# EasyEDA Pro project ProPrj_μAtlas-Pro_2026-10-24.epro, schematic μAtlas

## Sheets
1 PWR_Management
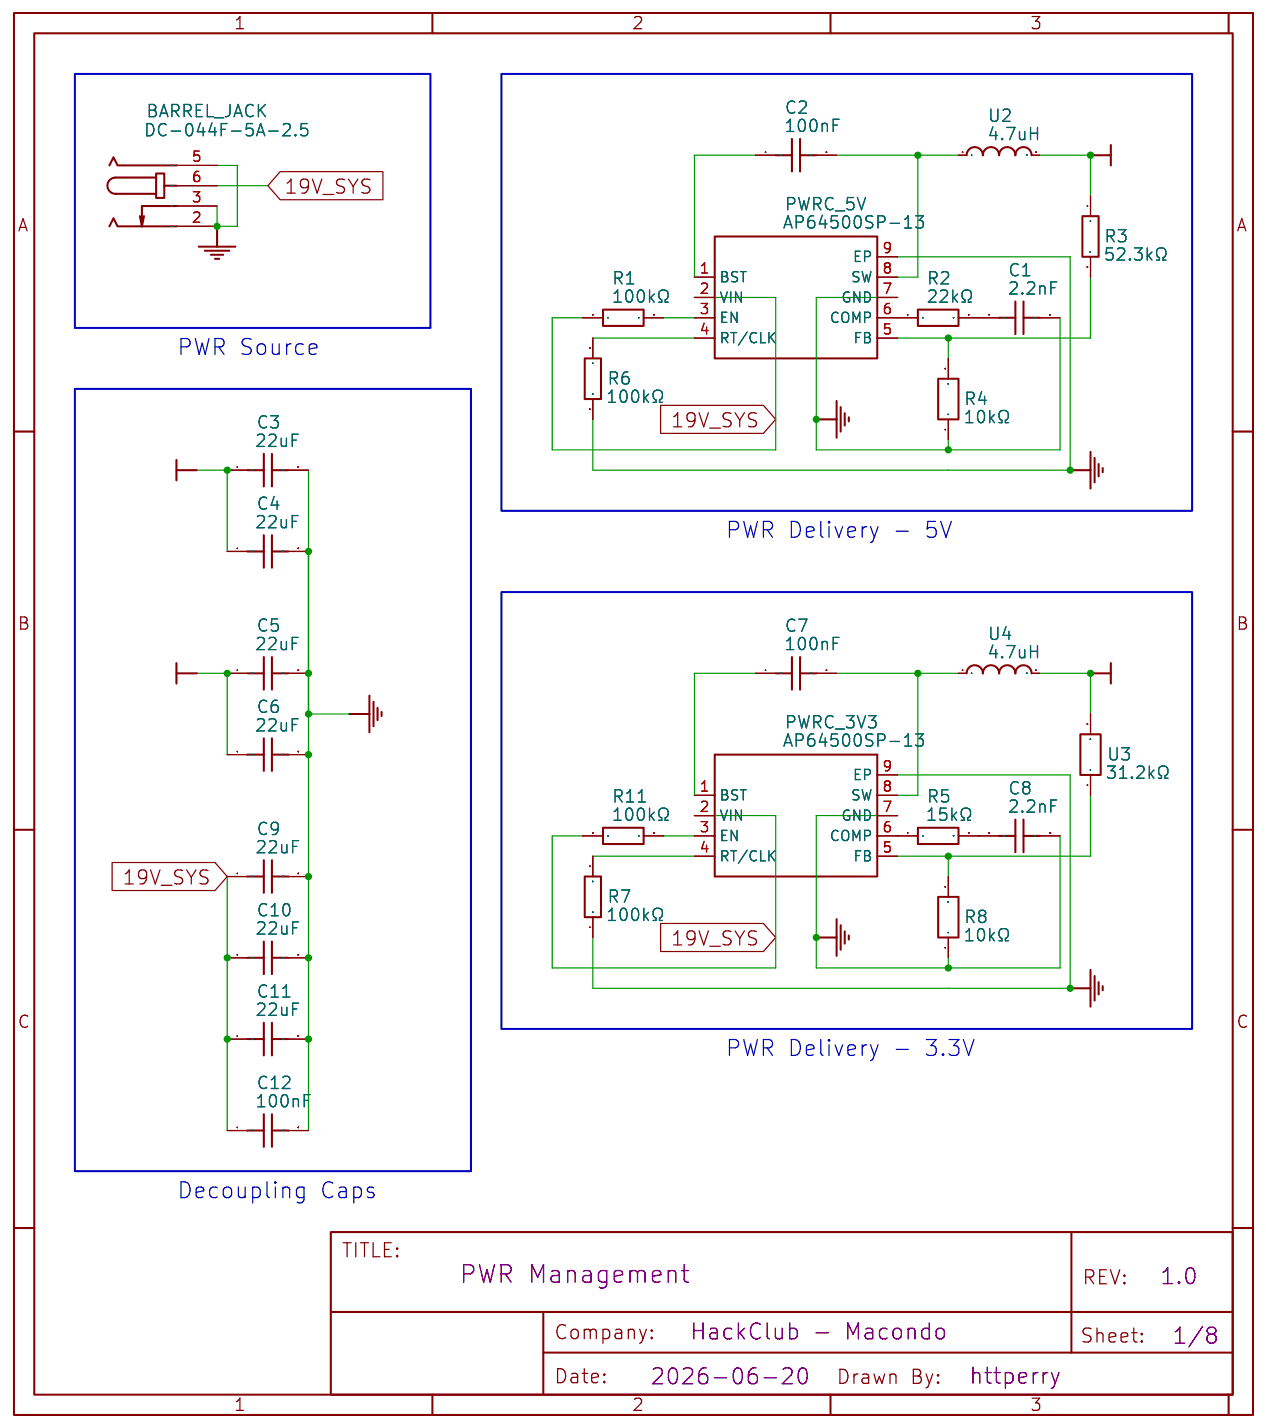
[diagram p0: PWR_Management]
2 SATA_Ports
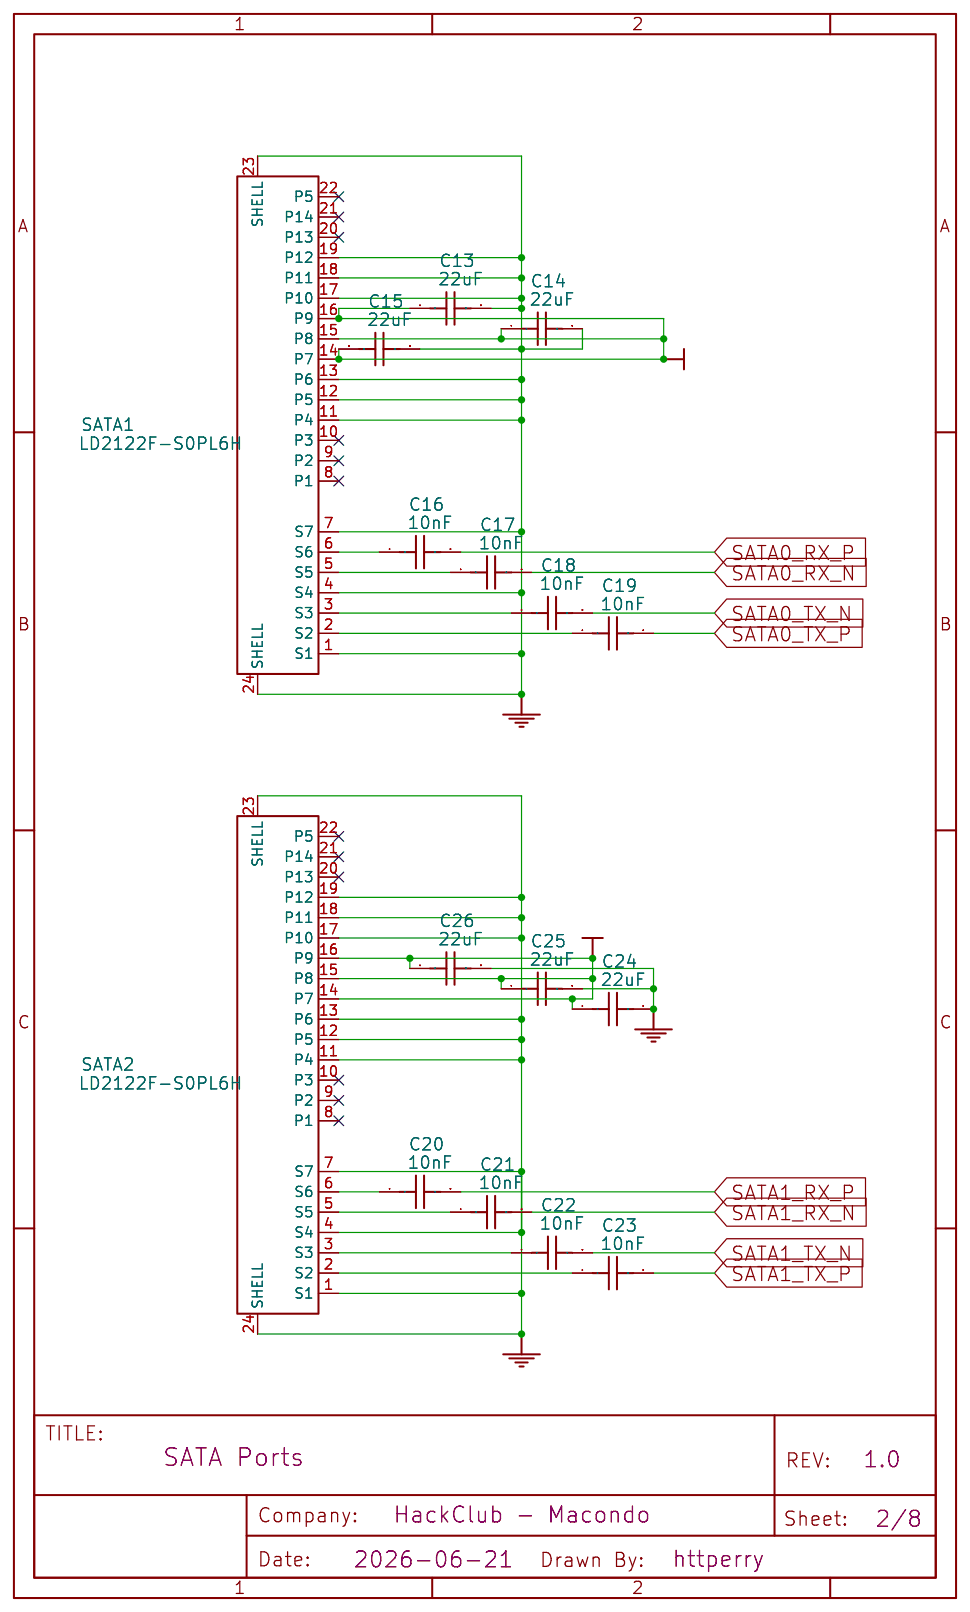
[diagram p1: SATA_Ports]
3 NVMe_(Networking)_Ports
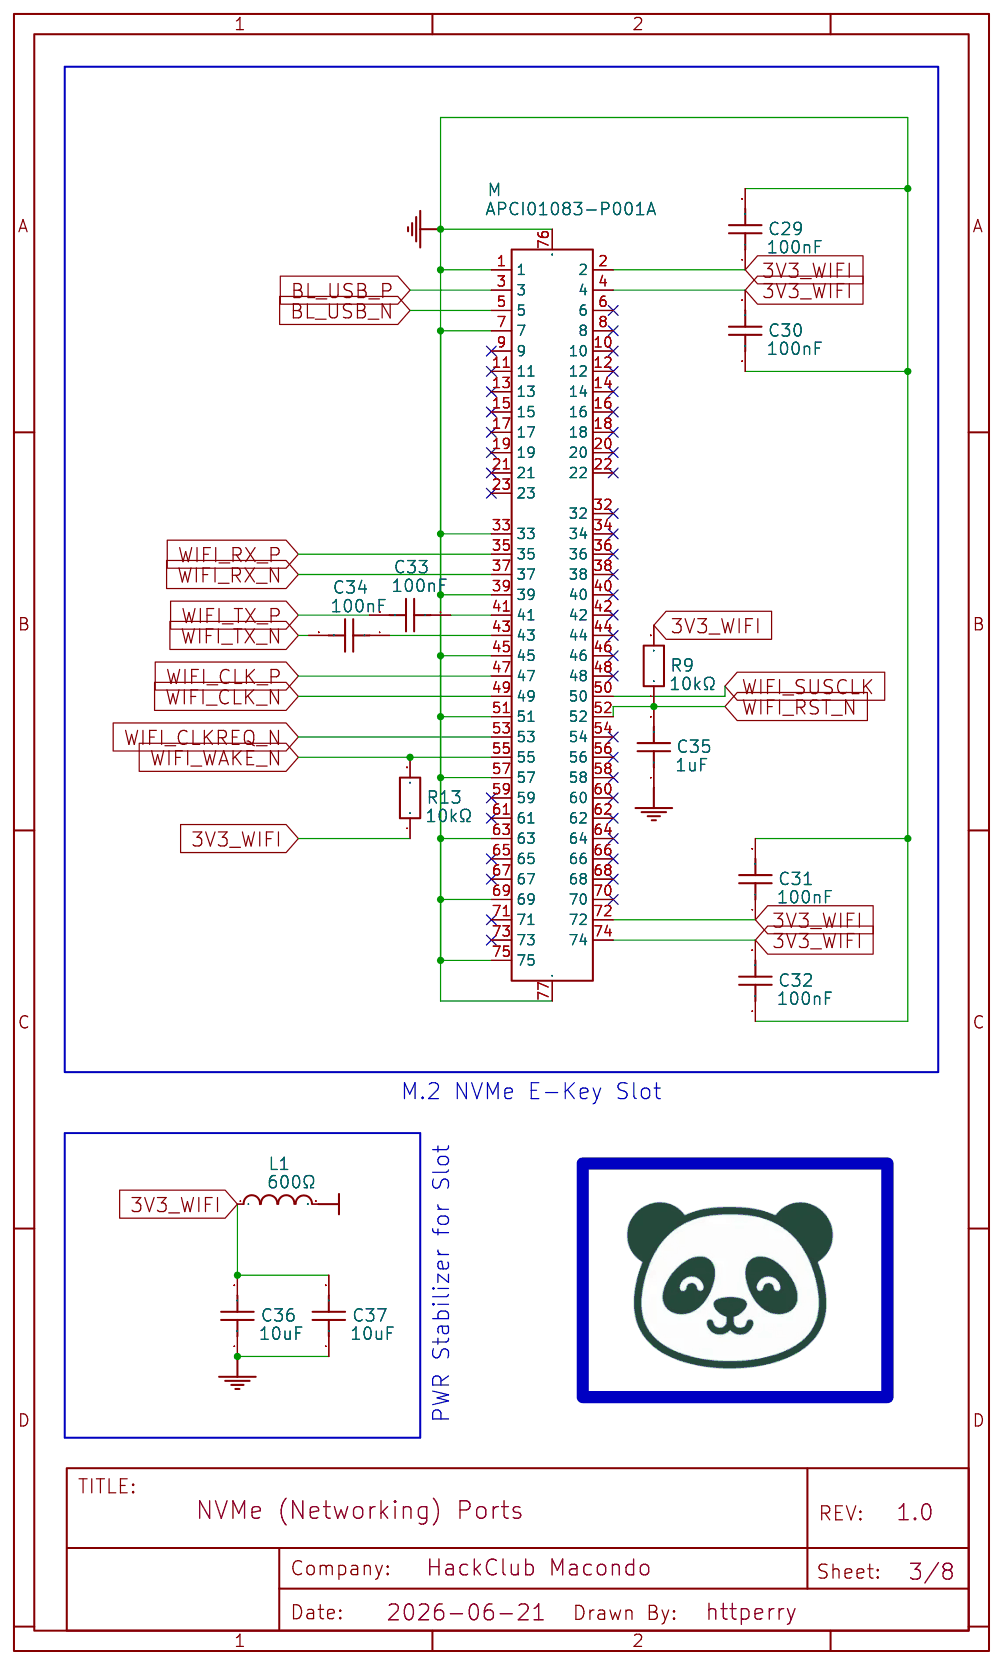
[diagram p2: NVMe_(Networking)_Ports]
4 NVMe_(Storage)_Ports
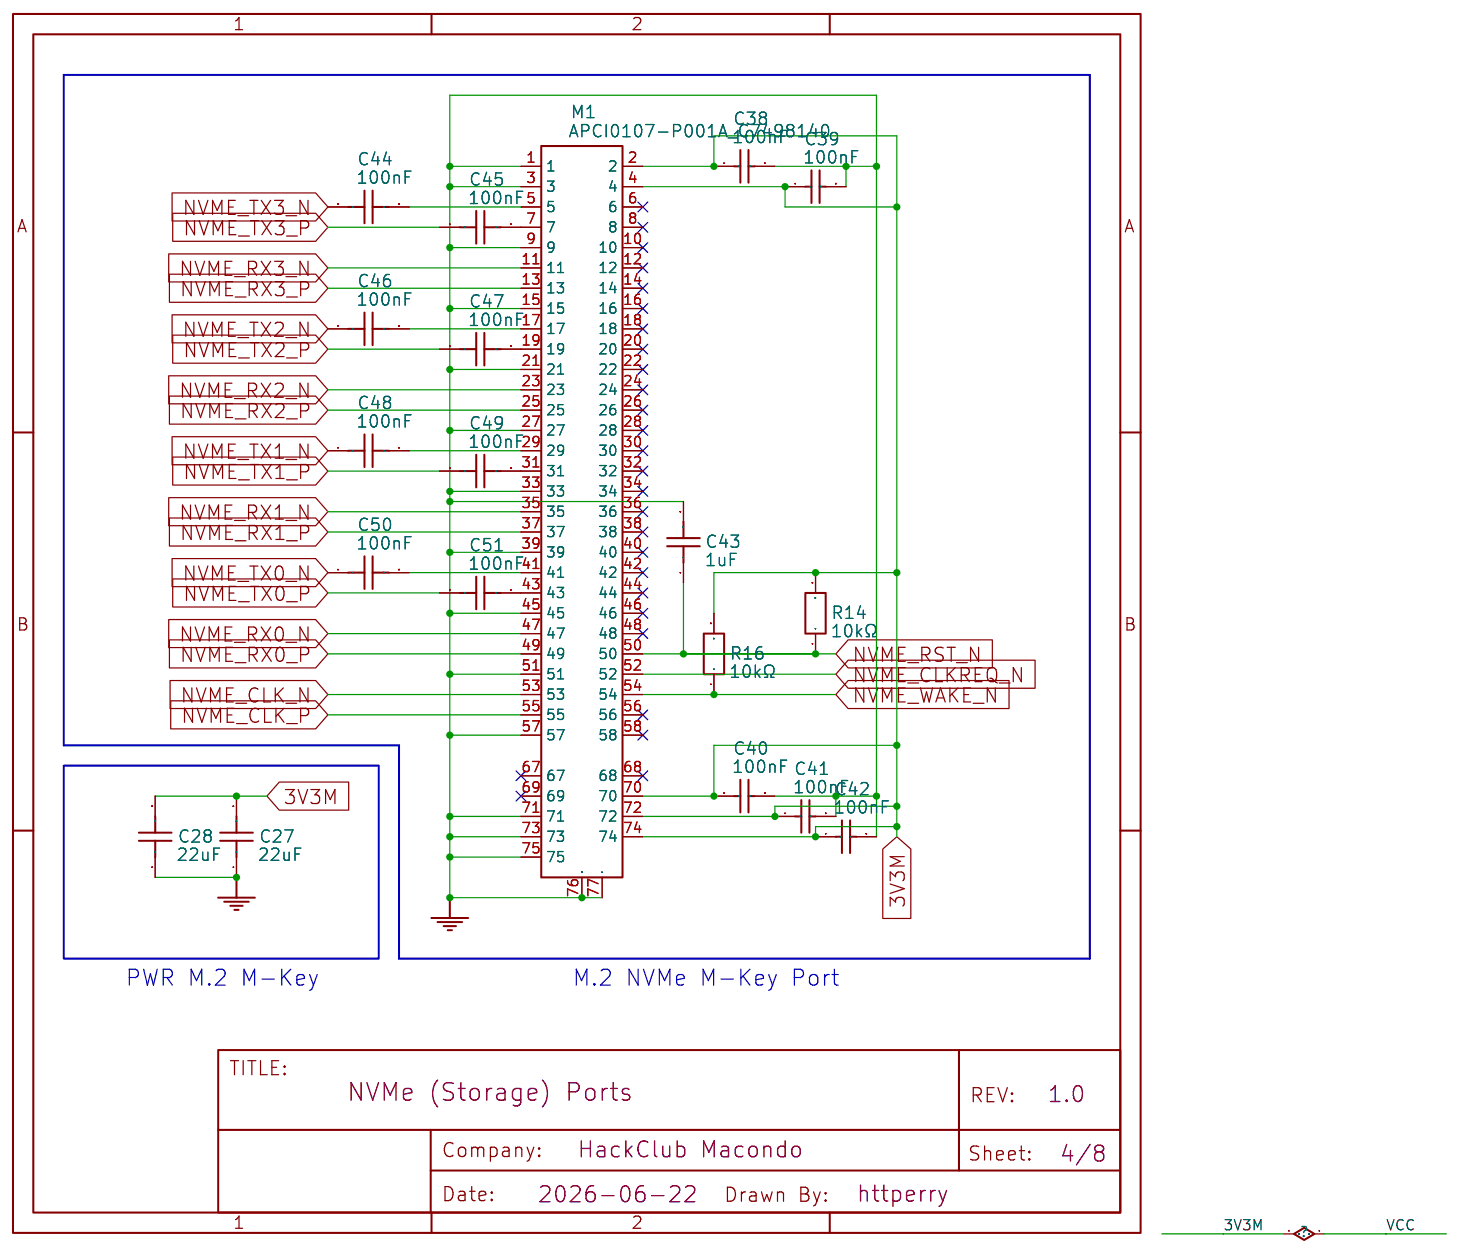
[diagram p3: NVMe_(Storage)_Ports]
5 IO_Ethernet
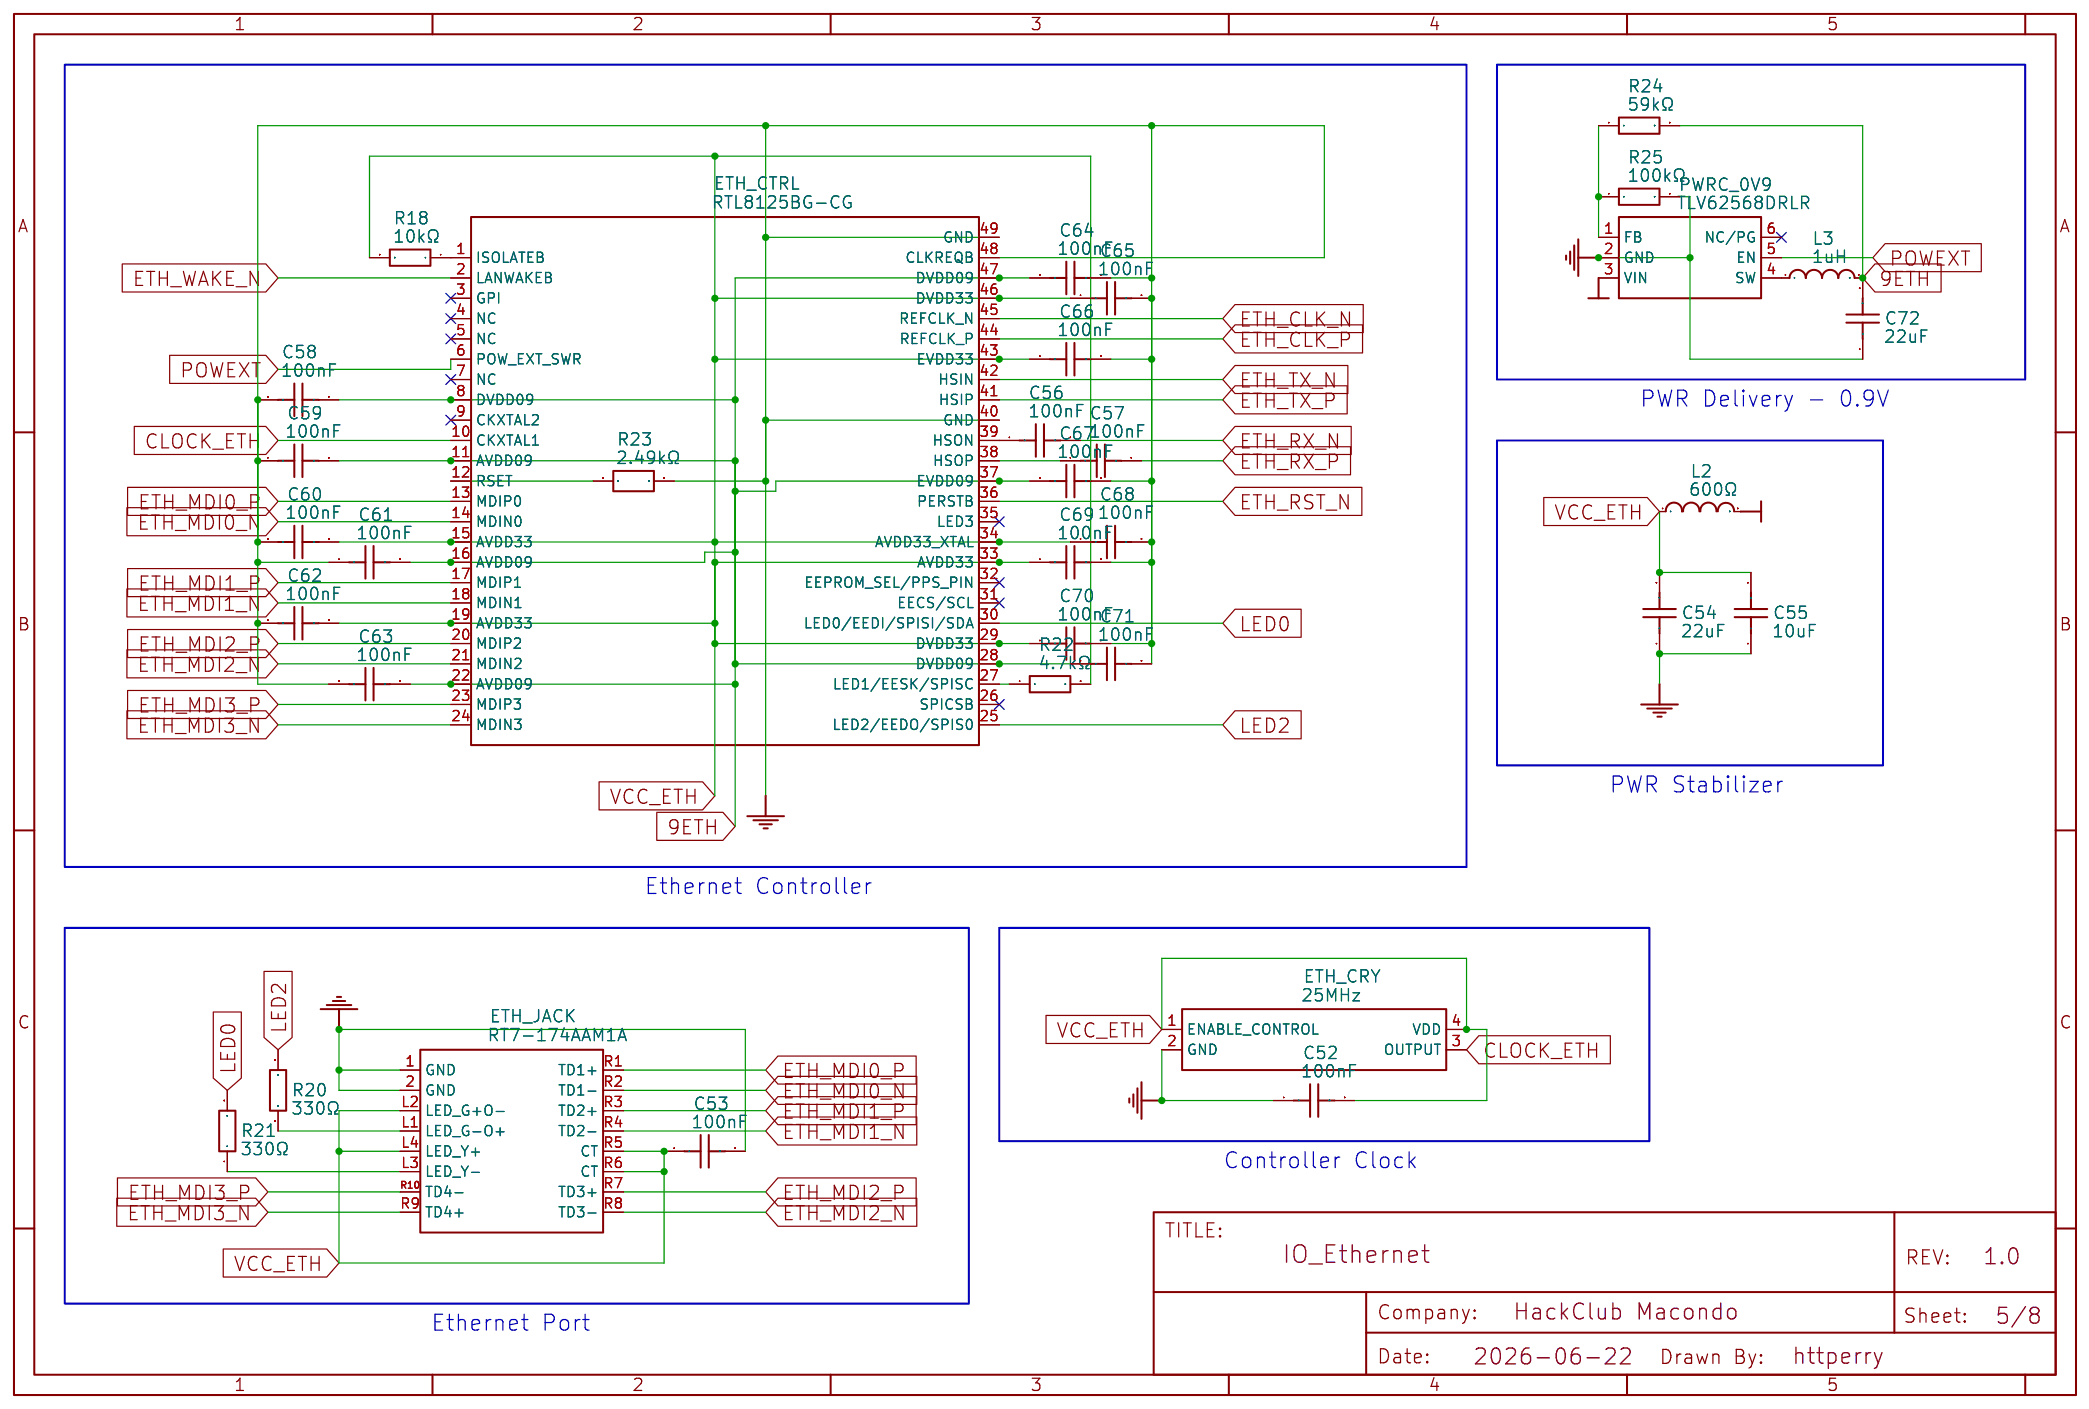
[diagram p4: IO_Ethernet]
6 IO_USB
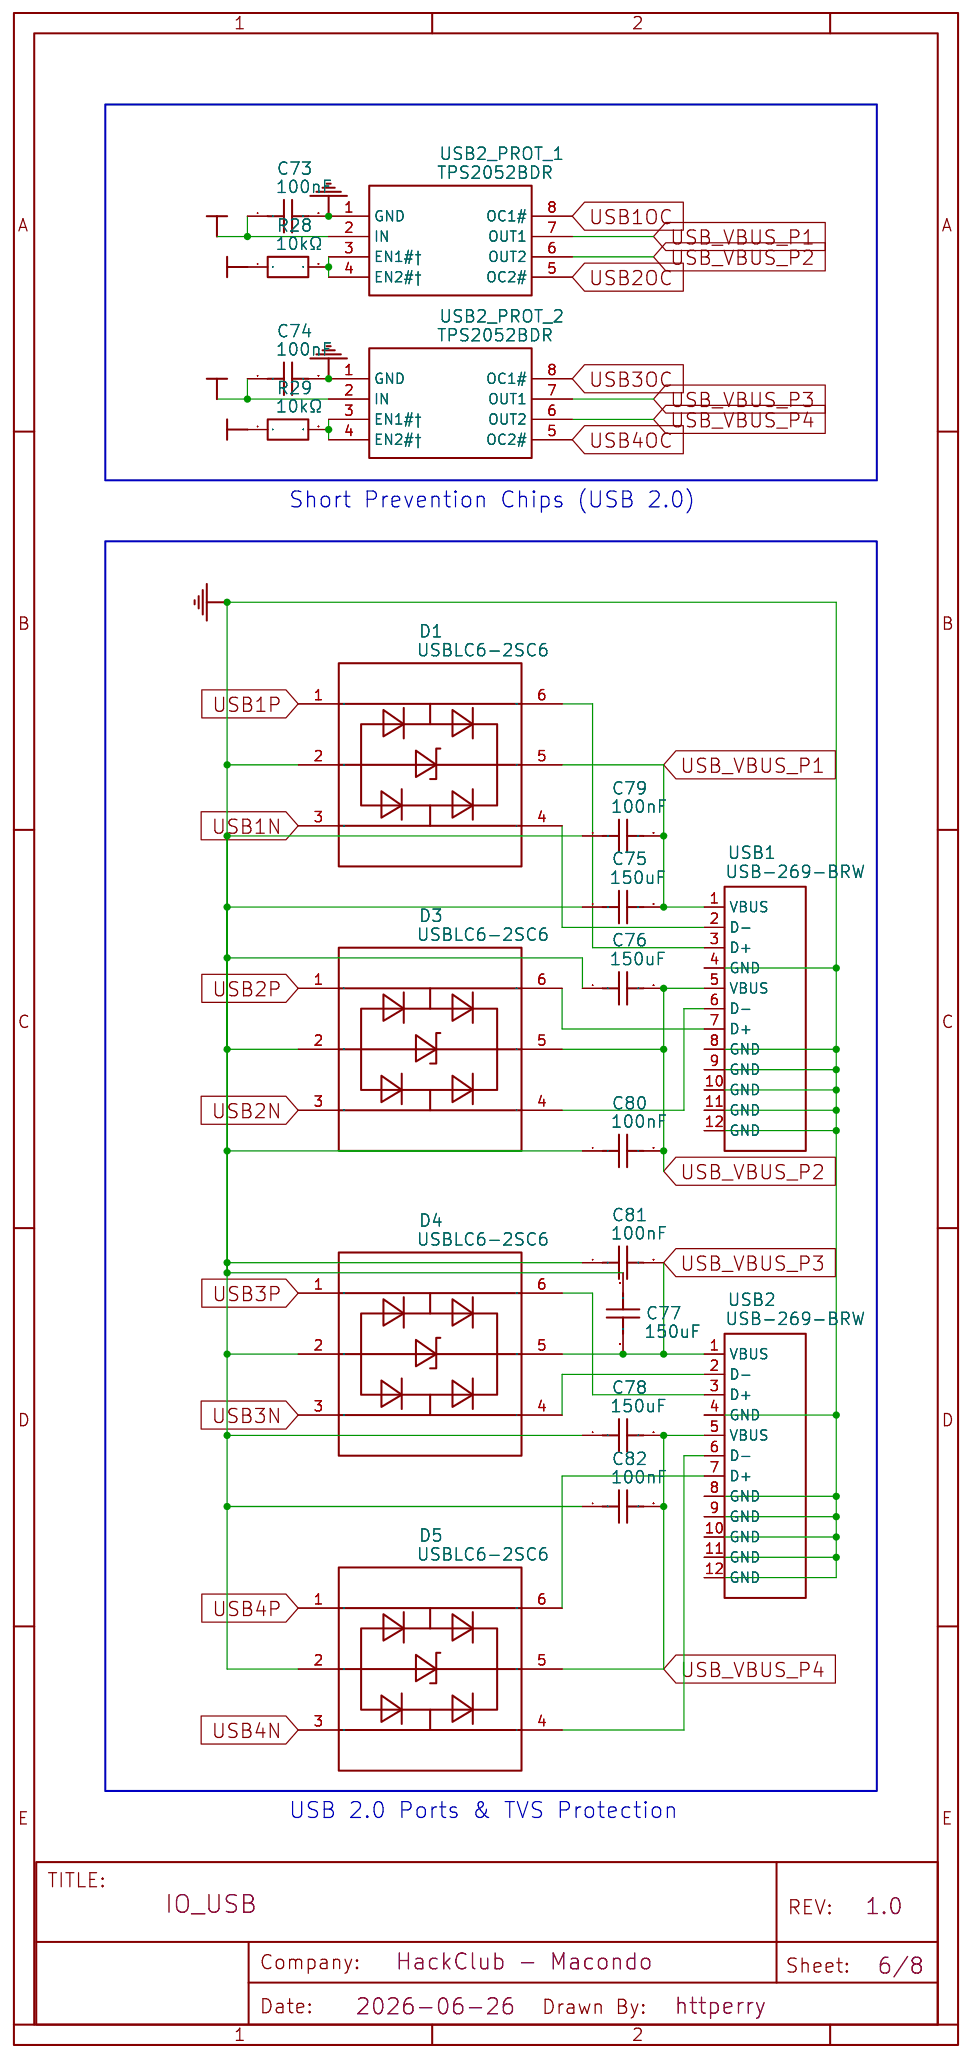
[diagram p5: IO_USB]
7 IO_HDMI
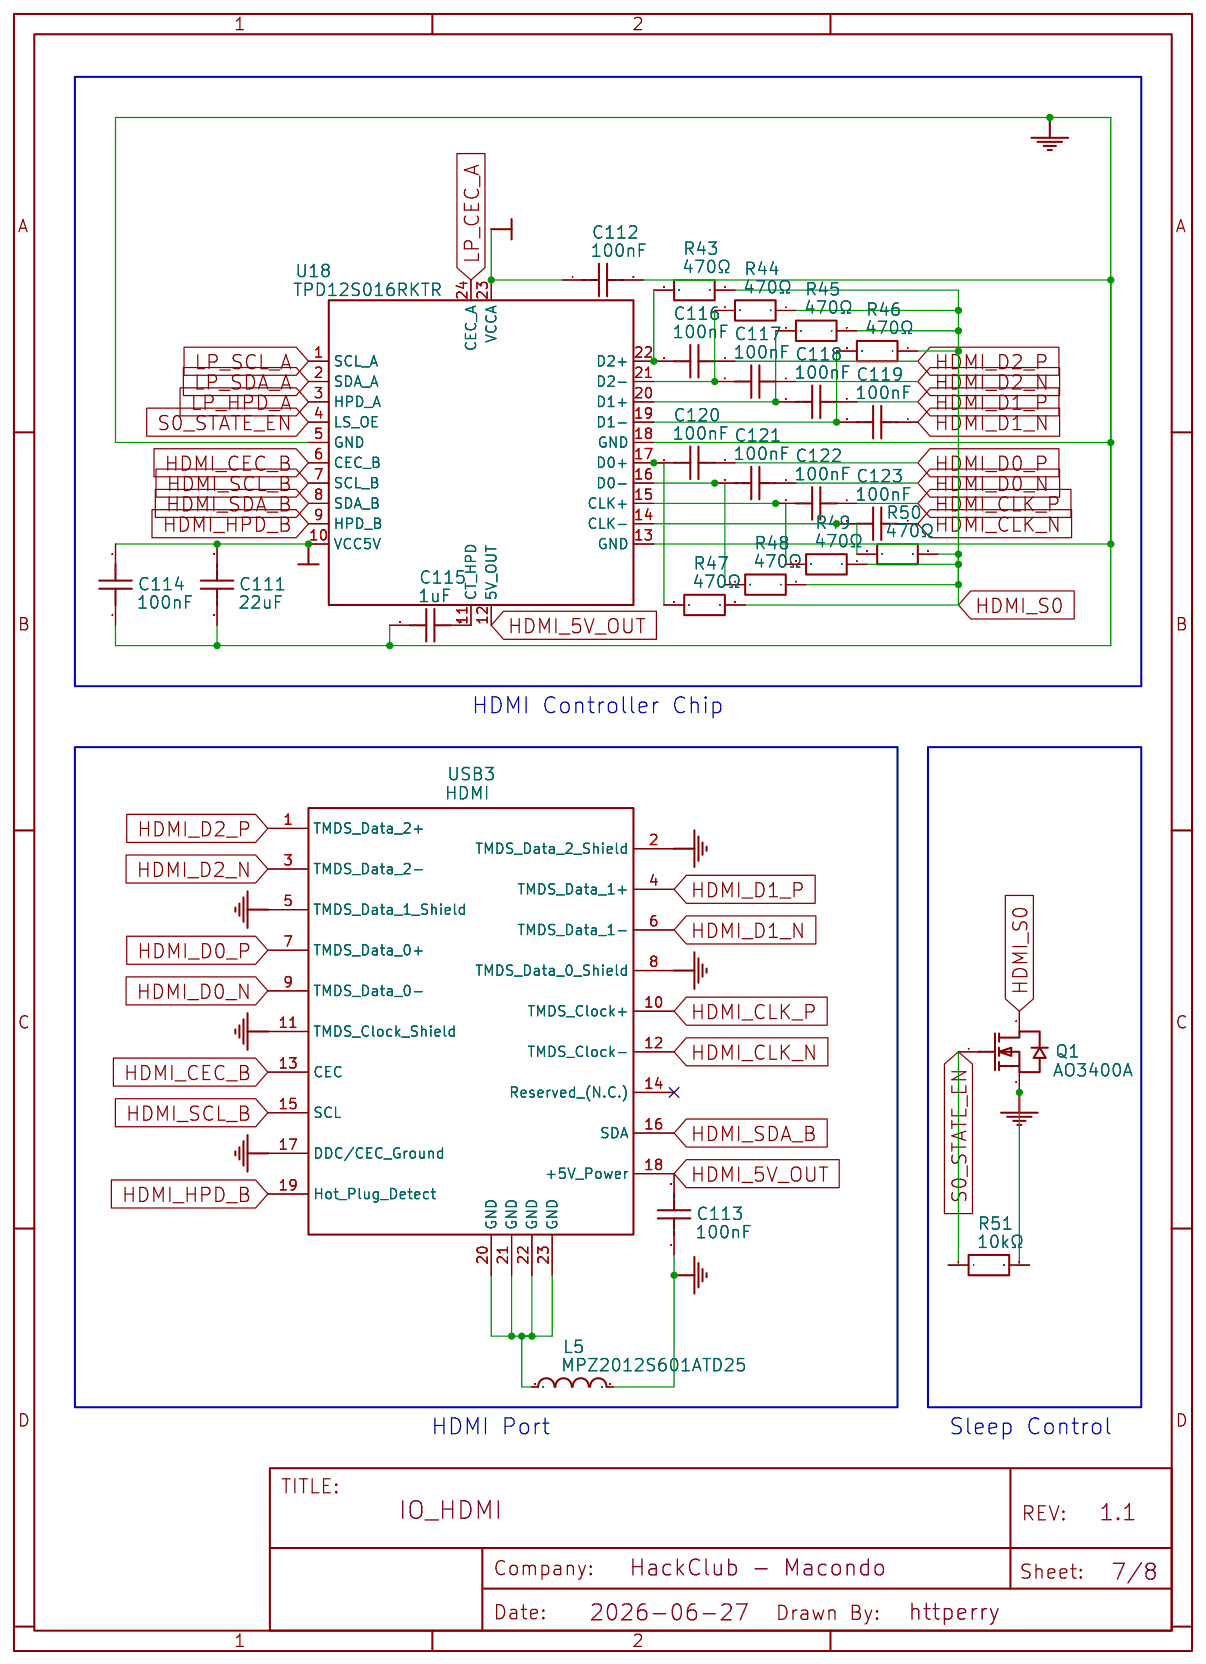
[diagram p6: IO_HDMI]
8 SoM_SODIMM
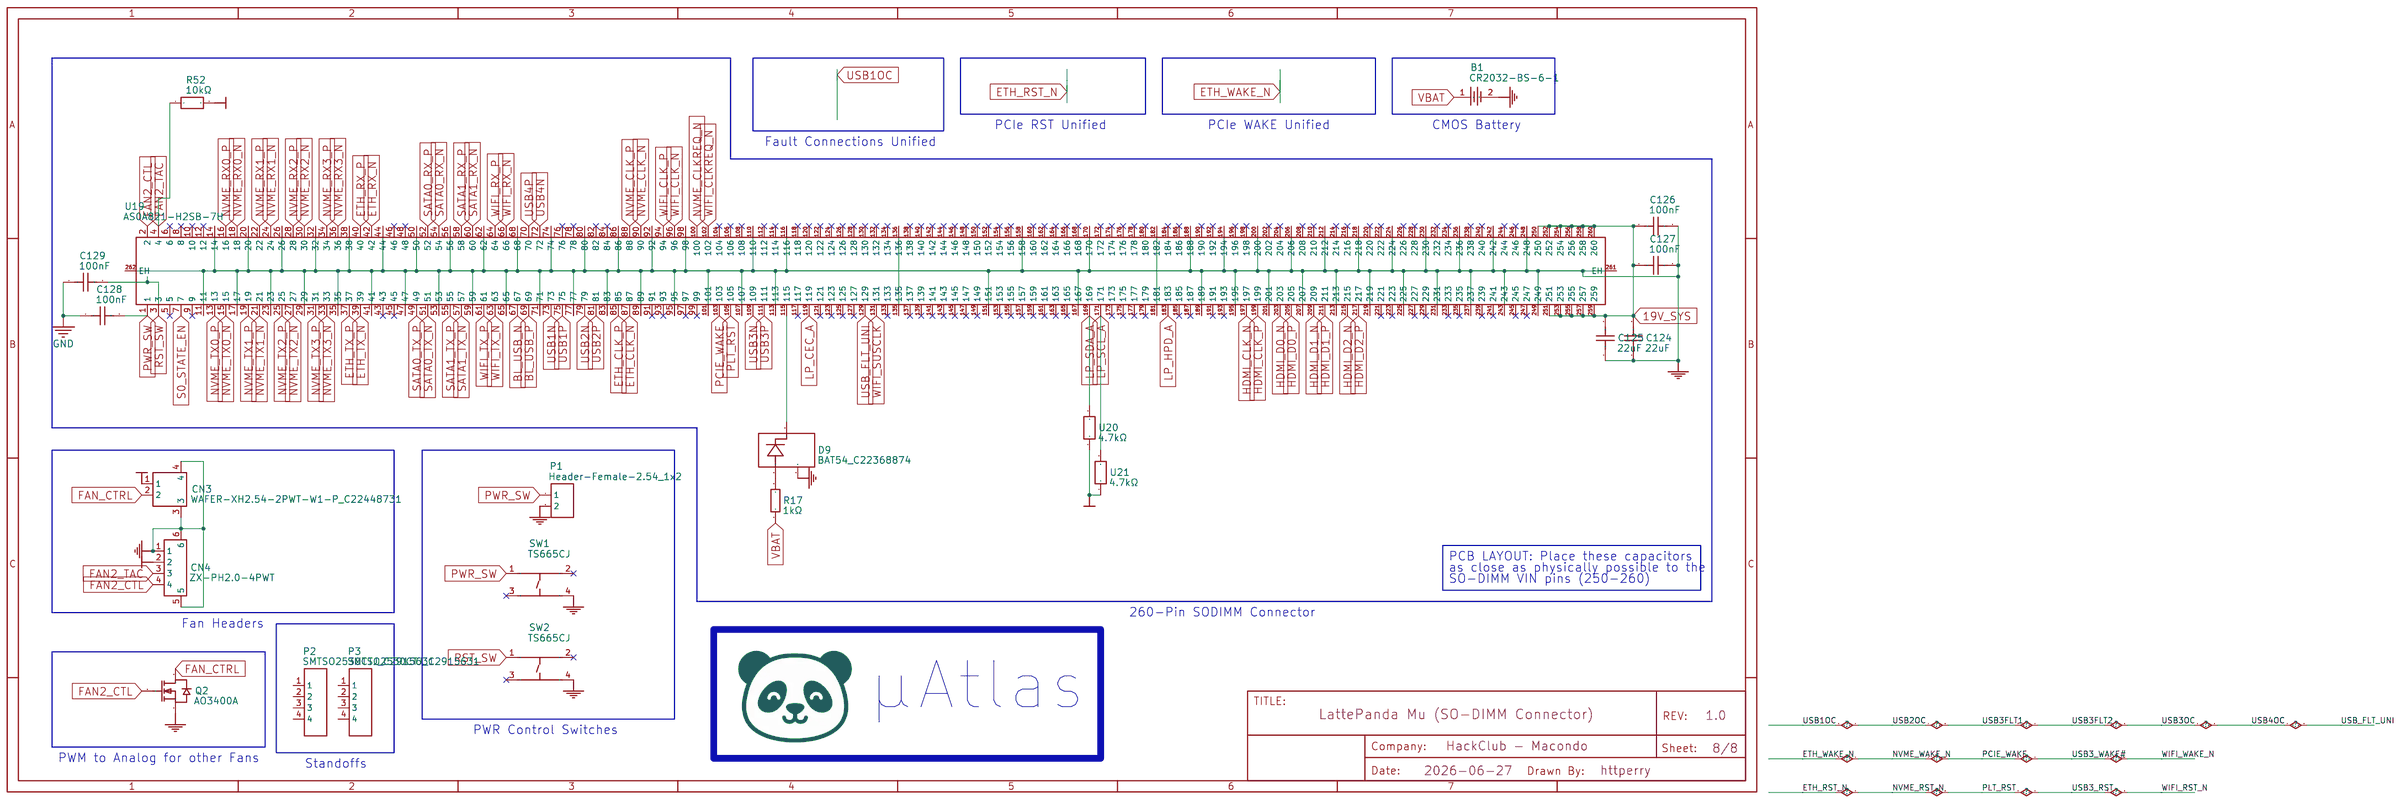
[diagram p7: SoM_SODIMM]

## Parts
sheet IO_Ethernet
C52  100nF  [C0402]
C53  100nF  [C0402]
C54  22uF  [C0805]
C55  10uF  [normalized-easyedapro:C0805]
C56  100nF  [C0402]
C57  100nF  [C0402]
C58  100nF  [C0402]
C59  100nF  [C0402]
C60  100nF  [C0402]
C61  100nF  [C0402]
C62  100nF  [C0402]
C63  100nF  [C0402]
C64  100nF  [C0402]
C65  100nF  [C0402]
C66  100nF  [C0402]
C67  100nF  [C0402]
C68  100nF  [C0402]
C69  100nF  [C0402]
C70  100nF  [C0402]
C71  100nF  [C0402]
C72  22uF  [normalized-easyedapro:C0805]
ETH_CRY  25MHz  [normalized-easyedapro:OSC-SMD_4P-L3.2-W2.5-BL_SG-8018CE]
ETH_CTRL  RTL8125BG-CG  [normalized-easyedapro:TQFN-48_L6.0-W6.0-P0.40-BL-EP4.5]
ETH_JACK  RT7-174AAM1A  [normalized-easyedapro:RJ45-TH_RT7-174AAM1A]
L2  600Ω  [normalized-easyedapro:L0805]
L3  1uH  [normalized-easyedapro:IND-SMD_L2.0-W1.6-B]
PWRC_0V9  TLV62568DRLR  [SOT-563_L1.6-W1.2-P0.50-LS1.6-BL]
R18  10kΩ  [normalized-easyedapro:R0402]
R20  330Ω  [normalized-easyedapro:R0402]
R21  330Ω  [R0402]
R22  4.7kΩ  [normalized-easyedapro:R0402]
R23  2.49kΩ  [normalized-easyedapro:R0402]
R24  59kΩ  [normalized-easyedapro:R0603]
R25  100kΩ  [normalized-easyedapro:R0603]
sheet IO_HDMI
C111  22uF  [C0805]
C112  100nF  [C0402]
C113  100nF  [C0402]
C114  100nF  [C0402]
C115  1uF  [normalized-easyedapro:C0402]
C116  100nF  [normalized-easyedapro:C0402]
C117  100nF  [C0402]
C118  100nF  [normalized-easyedapro:C0402]
C119  100nF  [C0402]
C120  100nF  [C0402]
C121  100nF  [C0402]
C122  100nF  [C0402]
C123  100nF  [C0402]
L5  MPZ2012S601ATD25  [normalized-easyedapro:L0805]
Q1  AO3400A  [normalized-easyedapro:SOT-23-3_L2.9-W1.3-P1.90-LS2.4-BR]
R43  470Ω  [normalized-easyedapro:R0402]
R44  470Ω  [normalized-easyedapro:R0402]
R45  470Ω  [normalized-easyedapro:R0402]
R46  470Ω  [normalized-easyedapro:R0402]
R47  470Ω  [R0402]
R48  470Ω  [R0402]
R49  470Ω  [R0402]
R50  470Ω  [R0402]
R51  10kΩ  [R0402]
U18  TPD12S016RKTR  [normalized-easyedapro:UQFN-24_L4.0-W2.0-P0.40-BL]
USB3  HDMI  [normalized-easyedapro:HDMI-SMD_HDMI-001S]
sheet IO_USB
C73  100nF  [C0402]
C74  100nF  [C0402]
C75  150uF  [normalized-easyedapro:C1206]
C76  150uF  [normalized-easyedapro:C1206]
C77  150uF  [normalized-easyedapro:C1206]
C78  150uF  [normalized-easyedapro:C1206]
C79  100nF  [C0402]
C80  100nF  [C0402]
C81  100nF  [C0402]
C82  100nF  [C0402]
D1  USBLC6-2SC6  [normalized-easyedapro:SOT-23-6_L2.9-W1.6-P0.95-LS2.8-BL]
D3  USBLC6-2SC6  [normalized-easyedapro:SOT-23-6_L2.9-W1.6-P0.95-LS2.8-BL]
D4  USBLC6-2SC6  [normalized-easyedapro:SOT-23-6_L2.9-W1.6-P0.95-LS2.8-BL]
D5  USBLC6-2SC6  [normalized-easyedapro:SOT-23-6_L2.9-W1.6-P0.95-LS2.8-BL]
R28  10kΩ  [R0402]
R29  10kΩ  [R0402]
USB1  USB-269-BRW  [normalized-easyedapro:USB-A-TH_USB-269-BRW]
USB2  USB-269-BRW  [USB-A-TH_USB-269-BRW]
USB2_PROT_1  TPS2052BDR  [normalized-easyedapro:SOIC-8_L4.9-W3.9-P1.27-LS6.0-BL]
USB2_PROT_2  TPS2052BDR  [SOIC-8_L4.9-W3.9-P1.27-LS6.0-BL]
sheet NVMe_(Networking)_Ports
C29  100nF  [normalized-easyedapro:C0402]
C30  100nF  [C0402]
C31  100nF  [C0402]
C32  100nF  [C0402]
C33  100nF  [C0402]
C34  100nF  [C0402]
C35  1uF  [normalized-easyedapro:C0402]
C36  10uF  [normalized-easyedapro:C0805]
C37  10uF  [normalized-easyedapro:C0805]
L1  600Ω  [normalized-easyedapro:L0805]
M  APCI01083-P001A  [normalized-easyedapro:CONN-SMD_APCI01083-P001A]
R9  10kΩ  [R0402]
R13  10kΩ  [R0402]
sheet NVMe_(Storage)_Ports
C27  22uF  [normalized-easyedapro:C0805]
C28  22uF  [normalized-easyedapro:C0805]
C38  100nF  [normalized-easyedapro:C0402]
C39  100nF  [C0402]
C40  100nF  [C0402]
C41  100nF  [C0402]
C42  100nF  [C0402]
C43  1uF  [normalized-easyedapro:C0402]
C44  100nF  [C0402]
C45  100nF  [C0402]
C46  100nF  [C0402]
C47  100nF  [C0402]
C48  100nF  [C0402]
C49  100nF  [C0402]
C50  100nF  [C0402]
C51  100nF  [C0402]
M1  APCI0107-P001A_C7498140  [normalized-easyedapro:CONN-SMD_APCI0107-P001A]
R14  10kΩ  [R0402]
R16  10kΩ  [R0402]
sheet PWR_Management
BARREL_JACK  DC-044F-5A-2.5  [normalized-easyedapro:DC-IN-TH_DC-044F-5A-2.5]
C1  2.2nF  [normalized-easyedapro:C0603]
C2  100nF  [C0603]
C3  22uF  [C0603]
C4  22uF  [C0603]
C5  22uF  [C0603]
C6  22uF  [C0603]
C7  100nF  [C0603]
C8  2.2nF  [C0603]
C9  22uF  [normalized-easyedapro:CAP-SMD_L6.1-W5.3-L]
C10  22uF  [normalized-easyedapro:CAP-SMD_L6.1-W5.3-L]
C11  22uF  [normalized-easyedapro:CAP-SMD_L6.1-W5.3-L]
C12  100nF  [C0603]
PWRC_3V3  AP64500SP-13  [normalized-easyedapro:SO-8_L4.9-W3.9-P1.27-LS6.0-BL-EP]
PWRC_5V  AP64500SP-13  [normalized-easyedapro:SO-8_L4.9-W3.9-P1.27-LS6.0-BL-EP]
R1  100kΩ  [R0603]
R2  22kΩ  [normalized-easyedapro:R0603]
R3  52.3kΩ  [normalized-easyedapro:R0603]
R4  10kΩ  [normalized-easyedapro:R0603]
R5  15kΩ  [normalized-easyedapro:R0603]
R6  100kΩ  [R0603]
R7  100kΩ  [R0603]
R8  10kΩ  [R0603]
R11  100kΩ  [R0603]
U2  4.7uH  [normalized-easyedapro:IND-SMD_L7.0-W6.6_APH0630]
U3  31.2kΩ  [normalized-easyedapro:R0603]
U4  4.7uH  [normalized-easyedapro:IND-SMD_L7.0-W6.6_APH0630]
sheet SATA_Ports
C13  22uF  [normalized-easyedapro:C0603]
C14  22uF  [C0603]
C15  22uF  [C0603]
C16  10nF  [C0402]
C17  10nF  [C0402]
C18  10nF  [C0402]
C19  10nF  [C0402]
C20  10nF  [normalized-easyedapro:C0402]
C21  10nF  [C0402]
C22  10nF  [C0402]
C23  10nF  [C0402]
C24  22uF  [C0603]
C25  22uF  [C0603]
C26  22uF  [C0603]
SATA1  LD2122F-S0PL6H  [normalized-easyedapro:CONN-SMD_LD2122F-S0PL6H]
SATA2  LD2122F-S0PL6H  [CONN-SMD_LD2122F-S0PL6H]
sheet SoM_SODIMM
B1  CR2032-BS-6-1  [normalized-easyedapro:BAT-TH_CR2032-BS-6-1]
C124  22uF  [normalized-easyedapro:CAP-SMD_L6.1-W5.3-L]
C125  22uF  [normalized-easyedapro:CAP-SMD_L6.1-W5.3-L]
C126  100nF  [C0603]
C127  100nF  [C0603]
C128  100nF  [normalized-easyedapro:C0603]
C129  100nF  [C0603]
CN3  WAFER-XH2.54-2PWT-W1-P_C22448731  [normalized-easyedapro:CONN-SMD_2P-P2.50_WAFER-XH2.54-2PWT-W1-P]
CN4  ZX-PH2.0-4PWT  [normalized-easyedapro:CONN-SMD_ZX-PH2.0-4PWT]
D9  BAT54_C22368874  [normalized-easyedapro:SOT-23-3_L2.9-W1.3-P1.90-LS2.4-BR]
P1  Header-Female-2.54_1x2  [normalized-easyedapro:HDR-TH_2P-P2.54-V-F]
P2  SMTSO2530CTJ_C2915631  [normalized-easyedapro:SMD_BD5.6-L5.6-W5.6-D4.1]
P3  SMTSO2530CTJ_C2915631  [SMD_BD5.6-L5.6-W5.6-D4.1]
Q2  AO3400A  [SOT-23-3_L2.9-W1.3-P1.90-LS2.4-BR]
R17  1kΩ  [normalized-easyedapro:R0603]
R52  10kΩ  [normalized-easyedapro:R0402]
SW1  TS665CJ  [normalized-easyedapro:SW-TH_4P-L6.0-W6.0-P4.50-LS6.5]
SW2  TS665CJ  [normalized-easyedapro:SW-TH_4P-L6.0-W6.0-P4.50-LS6.5]
U19  AS0A821-H2SB-7H  [normalized-easyedapro:CONN-SMD_AS0A821-H2SB-7H]
U20  4.7kΩ  [normalized-easyedapro:R0402]
U21  4.7kΩ  [R0402]

## Library data of the parts
C44-C47 C52 C53 C56-C71 C73 C74 C79-C82 C112-C114 C116-C123 = GRM155R71H104KE14J: Supplier: LCSC; Supplier Part: C2649519; Manufacturer: muRata(村田); JLCPCB Part Class: Extended Part; Origin 3D Model Title: C0402_L1.0-W0.5-H0.5
C54 C72 C111 = GRT21BR61E226ME13L: Supplier: LCSC; Supplier Part: C398931; Manufacturer: muRata(村田); JLCPCB Part Class: Extended Part; Origin 3D Model Title: C0805_L2.0-W1.3-H1.3
C55 = TCC0805X5R106K250FT: Supplier: LCSC; Supplier Part: C5448891; Manufacturer: CCTC(三环); JLCPCB Part Class: Extended Part; Origin 3D Model Title: C0805_L2.0-W1.3-H1.3
ETH_CRY = SX3M25.000B10G40TNN: Supplier: LCSC; Supplier Part: C5452698; Manufacturer: SCTF(星通时频); JLCPCB Part Class: Extended Part; Origin 3D Model Title: OSC-SMD_4P-L3.2-W2.5-BL_SG-8018CE
ETH_CTRL = RTL8125BG-CG: Supplier: LCSC; Supplier Part: C3013605; Manufacturer: REALTEK(瑞昱); JLCPCB Part Class: Extended Part; Origin 3D Model Title: TQFN-48_L6.0-W6.0-P0.40-BL-EP4.5
ETH_JACK = RT7-174AAM1A: Supplier: LCSC; Supplier Part: C711505; Manufacturer: UDE(涌德电子); JLCPCB Part Class: Extended Part; Origin 3D Model Title: RJ45-TH_RT7-174AAM1A
L1 L2 = MPZ2012S601AT000: Supplier: LCSC; Manufacturer: TDK; Supplier Part: C21519; JLCPCB Part Class: Extended Part; Origin 3D Model Title: R0805_L2.0-W1.3-H0.6
L3 = XRIM201612S1R0MBCA: Supplier: LCSC; Supplier Part: C22471099; Manufacturer: XR(祥如); JLCPCB Part Class: Extended Part; Origin 3D Model Title: IND-SMD_L2.0-W1.6-B
PWRC_0V9 = TLV62568DRLR: Supplier: LCSC; Supplier Part: C398370; Manufacturer: TI(德州仪器); JLCPCB Part Class: Extended Part; Origin 3D Model Title: SOT-563-6P_L1.6-W1.2-H0.6-LS1.6-P0.50
R18 = ERA2AEB103X: Supplier: LCSC; Supplier Part: C191915; Manufacturer: PANASONIC(松下); JLCPCB Part Class: Extended Part; Origin 3D Model Title: R0402_L1.0-W0.5-H0.4
R20 R21 = RC0402JR-07330RL: Supplier: LCSC; Manufacturer: YAGEO(国巨); Supplier Part: C105876; JLCPCB Part Class: Extended Part; Origin 3D Model Title: R0402_L1.0-W0.5-H0.4
R22 = RC0402FR-074K7L: Supplier: LCSC; Manufacturer: YAGEO(国巨); Supplier Part: C105871; JLCPCB Part Class: Extended Part; Origin 3D Model Title: R0402_L1.0-W0.5-H0.4
R23 = FRC0402F2491TS: Supplier: LCSC; Supplier Part: C2933083; Manufacturer: FOJAN(富捷); JLCPCB Part Class: Extended Part; Origin 3D Model Title: R0402_L1.0-W0.5-H0.4
R24 = RS-03K5902FT: Supplier: LCSC; Supplier Part: C321955; Manufacturer: FH(风华); JLCPCB Part Class: Extended Part; Origin 3D Model Title: R0603
R25 = RS-03K1003FT: Supplier: LCSC; Manufacturer: FH(风华); Supplier Part: C115320; JLCPCB Part Class: Extended Part; Origin 3D Model Title: R0603
C115 = MSASU105CB5105KFNA01: Supplier: LCSC; Supplier Part: C7001784; Manufacturer: TAIYO YUDEN(太诱); JLCPCB Part Class: Extended Part; Origin 3D Model Title: C0402_L1.0-W0.5-H0.5
L5 = MPZ2012S601ATD25: Supplier: LCSC; Supplier Part: C81034; Manufacturer: TDK; JLCPCB Part Class: Extended Part; Origin 3D Model Title: R0805_L2.0-W1.3-H0.6
Q1 Q2 = AO3400A: Supplier: LCSC; Manufacturer: AOS; Supplier Part: C20917; JLCPCB Part Class: Basic Part; Origin 3D Model Title: SOT-23-3P_L2.9-W1.3-H1.0-LS2.4-P0.95
R43-R50 = FRC0402F4700TS: Supplier: LCSC; Supplier Part: C2909361; Manufacturer: FOJAN(富捷); JLCPCB Part Class: Extended Part; Origin 3D Model Title: R0402_L1.0-W0.5-H0.4
R9 R14 R16 R28 R29 R51 R52 = FRC0402F1002TS: Supplier: LCSC; Supplier Part: C2906861; Manufacturer: FOJAN(富捷); JLCPCB Part Class: Extended Part; Origin 3D Model Title: R0402_L1.0-W0.5-H0.4
U18 = TPD12S016RKTR: Supplier: LCSC; Supplier Part: C165140; Manufacturer: TI(德州仪器); JLCPCB Part Class: Extended Part; Origin 3D Model Title: UQFN-24_L4.0-W2.0-H0.6-P0.40-BL
USB3 = HDMI-001S: Supplier: LCSC; Supplier Part: C720616; Manufacturer: XUNPU(讯普); JLCPCB Part Class: Extended Part; Origin 3D Model Title: HDMI-SMD_HDMI-001S
C75-C78 = GRM31CR60J157ME11L: Supplier: LCSC; Supplier Part: C528968; Manufacturer: muRata(村田); JLCPCB Part Class: Extended Part; Origin 3D Model Title: C1206_L3.2-W1.6-H1.3
D1 D3-D5 = USBLC6-2SC6: Supplier: LCSC; Manufacturer: ST(意法半导体); Supplier Part: C7519; JLCPCB Part Class: Extended Part; Origin 3D Model Title: SOT-23-6_L2.9-W1.6-H1.5-LS2.8-P0.95
USB1 = USB-269-BRW: Supplier: LCSC; Supplier Part: C720548; Manufacturer: XUNPU(讯普); JLCPCB Part Class: Extended Part; Origin 3D Model Title: USB-A-TH_USB-269-BRW
USB2 = USB-269-BRW: Supplier: LCSC; Supplier Part: C720548; Manufacturer: XUNPU(讯普); JLCPCB Part Class: Extended Part
USB2_PROT_1 USB2_PROT_2 = TPS2052BDR: Supplier: LCSC; Manufacturer: TI(德州仪器); Supplier Part: C130049; JLCPCB Part Class: Extended Part; Origin 3D Model Title: SOIC-8_L4.9-W3.9-H1.7-LS6.0-P1.27
C29-C34 = CC0402KRX5R6BB104: Supplier: LCSC; Supplier Part: C129131; Manufacturer: YAGEO(国巨); JLCPCB Part Class: Extended Part; Origin 3D Model Title: C0402_L1.0-W0.5-H0.5
C35 = TCC0402X5R105K160AT: Supplier: LCSC; Supplier Part: C5142580; Manufacturer: CCTC(三环); JLCPCB Part Class: Extended Part; Origin 3D Model Title: C0402_L1.0-W0.5-H0.5
C36 C37 = CGA0805X5R106K500MT: Supplier: LCSC; Supplier Part: C6119889; Manufacturer: HRE(芯声); JLCPCB Part Class: Extended Part; Origin 3D Model Title: C0805_L2.0-W1.3-H1.3
M = APCI01083-P001A: Supplier: LCSC; Supplier Part: C41425435; Manufacturer: LX(连欣科技); JLCPCB Part Class: Extended Part
R13 = FRC0402F1002TS: Supplier: LCSC; Supplier Part: C2906861; Manufacturer: FOJAN(富捷); JLCPCB Part Class: Extended Part; Origin 3D Model Title: R0402_L1.0-W0.5-H0.4; link: https://lcsc.com/eda_search?q=C2906861&%26type=1&ref=editor
C27 C28 = CL21A226MAYNNNE: Supplier: LCSC; Supplier Part: C602037; Manufacturer: SAMSUNG(三星); JLCPCB Part Class: Extended Part; Origin 3D Model Title: C0805_L2.0-W1.3-H1.3
C38-C42 = CC0402KRX5R8BB104: Supplier: LCSC; Manufacturer: YAGEO(国巨); Supplier Part: C106256; JLCPCB Part Class: Extended Part; Origin 3D Model Title: C0402_L1.0-W0.5-H0.5
C43 = HGC0402R5105K500NTEJ: Supplier: LCSC; Supplier Part: C7472948; Manufacturer: Chinocera(华瓷); JLCPCB Part Class: Extended Part; Origin 3D Model Title: C0402_L1.0-W0.5-H0.5
C48-C51 = GRM155R71H104KE14J: Supplier: LCSC; Supplier Part: C2649519; Manufacturer: muRata(村田); JLCPCB Part Class: Extended Part; Origin 3D Model Title: C0402_L1.0-W0.5-H0.5; link: https://lcsc.com/eda_search?q=C2649519&%26type=1&ref=editor
M1 = APCI0107-P001A: Supplier: LCSC; Supplier Part: C7498140; Manufacturer: LX(连欣科技); JLCPCB Part Class: Extended Part; Origin 3D Model Title: CONN-SMD_APCI0107-P001A
BARREL_JACK = DC-044F-5A-2.5: Supplier: LCSC; Supplier Part: C779941; Manufacturer: XKB Connection(中国星坤); JLCPCB Part Class: Extended Part
C1 C8 = FCC0603B222K500CT: Supplier: LCSC; Supplier Part: C5137562; Manufacturer: FOJAN(富捷); JLCPCB Part Class: Extended Part; Origin 3D Model Title: C0603_L1.6-W0.8-H0.8
C2 C7 C12 C126-C129 = GRM188R71H104KA93D: Supplier: LCSC; Manufacturer: muRata(村田); Supplier Part: C77055; JLCPCB Part Class: Extended Part; Origin 3D Model Title: C0603_L1.6-W0.8-H0.8
C3-C6 C13-C15 C24-C26 = HGC0603R5226M160NTHJ: Supplier: LCSC; Supplier Part: C22367828; Manufacturer: Chinocera(华瓷); JLCPCB Part Class: Extended Part; Origin 3D Model Title: C0603_L1.6-W0.8-H0.8
C9-C11 C124 C125 = KCM55QR71H226KH13K: Supplier: LCSC; Supplier Part: C6579204; Manufacturer: muRata(村田); JLCPCB Part Class: Extended Part; Origin 3D Model Title: CAP-SMD_L6.1-W5.3-H3.7
PWRC_3V3 PWRC_5V = AP64500SP-13: Supplier: LCSC; Supplier Part: C2070920; Manufacturer: DIODES(美台); JLCPCB Part Class: Extended Part; Origin 3D Model Title: SO-8_L4.9-W3.9-H1.5-LS5.9-P1.27
R1 R6 R7 R11 = RS-03K1003FT: Supplier: LCSC; Manufacturer: FH(风华); Supplier Part: C115320; JLCPCB Part Class: Extended Part
R2 = RS-03K2202FT: Supplier: LCSC; Supplier Part: C286577; Manufacturer: FH(风华); JLCPCB Part Class: Extended Part; Origin 3D Model Title: R0603
R3 = RS-03K5232FT: Supplier: LCSC; Supplier Part: C304764; Manufacturer: FH(风华); JLCPCB Part Class: Extended Part; Origin 3D Model Title: R0603
R4 = AR03BTS1002: Supplier: LCSC; Supplier Part: C20607729; Manufacturer: Viking(光颉); JLCPCB Part Class: Extended Part; Origin 3D Model Title: R0603
R5 = CR0603FA1502G: Supplier: LCSC; Manufacturer: LIZ(丽智电子); Supplier Part: C100780; JLCPCB Part Class: Extended Part; Origin 3D Model Title: R0603
R8 = AR03BTS1002: Supplier: LCSC; Supplier Part: C20607729; Manufacturer: Viking(光颉); JLCPCB Part Class: Extended Part
U2 U4 = APH0630T4R7M: Supplier: LCSC; Supplier Part: C5349705; Manufacturer: APV(爱普微); JLCPCB Part Class: Extended Part; Origin 3D Model Title: IND-SMD_L7.0-W6.6_APH0630
U3 = RT0603DRE0731K2L: Supplier: LCSC; Supplier Part: C863036; Manufacturer: YAGEO(国巨); JLCPCB Part Class: Extended Part; Origin 3D Model Title: R0603
C16-C23 = FCC0402B103K500AT: Supplier: LCSC; Supplier Part: C5137480; Manufacturer: FOJAN(富捷); JLCPCB Part Class: Extended Part; link: https://lcsc.com/eda_search?q=C5137480&%26type=1&ref=editor; Origin 3D Model Title: C0402_L1.0-W0.5-H0.5
SATA1 = LD2122F-S0PL6H: Supplier: LCSC; Supplier Part: C2761452; Manufacturer: FOXCONN(富士康); JLCPCB Part Class: Extended Part; Origin 3D Model Title: CONN-SMD_LD2122F-S0PL6H
SATA2 = LD2122F-S0PL6H: Supplier: LCSC; Supplier Part: C2761452; Manufacturer: FOXCONN(富士康); JLCPCB Part Class: Extended Part
B1 = CR2032-BS-6-1: Supplier: LCSC; Manufacturer: QIJEY; Supplier Part: C70377; JLCPCB Part Class: Extended Part; Origin 3D Model Title: BAT-SMD_L28.5-W16.0-H5.5-LS31.3_CR2032-BS-6-1
CN3 = WAFER-XH2.54-2PWT-W1-P: Supplier: LCSC; Supplier Part: C22448731; Manufacturer: Zhongdi(众迪); JLCPCB Part Class: Extended Part
CN4 = ZX-PH2.0-4PWT: Supplier: LCSC; Supplier Part: C46533591; Manufacturer: Megastar(兆星); JLCPCB Part Class: Extended Part
D9 = BAT54: Supplier: LCSC; Supplier Part: C22368874; Manufacturer: Wild Goose(威谷); JLCPCB Part Class: Extended Part; Origin 3D Model Title: SOT-23-3P_L2.9-W1.3-H1.0-LS2.4-P0.95
P1 = 2.54-1*2P母: Supplier: LCSC; Manufacturer: BOOMELE(博穆精密); Supplier Part: C49661; JLCPCB Part Class: Extended Part; Origin 3D Model Title: HDR-TH_2P-P2.54-F-LI-1X2P
P2 = SMTSO2530CTJ: Supplier: LCSC; Supplier Part: C2915631; Manufacturer: Sinhoo(雄和远景); JLCPCB Part Class: Extended Part; Origin 3D Model Title: SMD_BD5.6-L5.6-W5.6-D4.1
P3 = SMTSO2530CTJ: Supplier: LCSC; Supplier Part: C2915631; Manufacturer: Sinhoo(雄和远景); JLCPCB Part Class: Extended Part
R17 = CR0603FA1001G: Supplier: LCSC; Manufacturer: LIZ(丽智电子); Supplier Part: C126900; JLCPCB Part Class: Extended Part; Origin 3D Model Title: R0603
SW1 SW2 = TS665CJ: Supplier: LCSC; Supplier Part: C393938; Manufacturer: SHOU HAN(首韩); JLCPCB Part Class: Extended Part; Origin 3D Model Title: SW-TH_4P-L6.0-W6.0-H5.0-LS6.5-P4.50
U19 = AS0A821-H2SB-7H: Supplier: LCSC; Supplier Part: C2832345; Manufacturer: FOXCONN(富士康); JLCPCB Part Class: Extended Part; Origin 3D Model Title: CONN-SMD_AS0A821-H2SB-7H
U20 U21 = FRC0402F4701TS: Supplier: LCSC; Supplier Part: C2906869; Manufacturer: FOJAN(富捷); JLCPCB Part Class: Extended Part; Origin 3D Model Title: R0402_L1.0-W0.5-H0.4

## Nets
3V3_WIFI: C29.1 C30.2 C31.1 C32.2 C36.2 C37.2 L1.1 M.2 M.4 M.72 M.74 R9.2 R13.1
19V_SYS: BARREL_JACK.6 C9.1 C10.1 C11.1 C12.1 C124.2 C125.2 C126.1 C127.1 PWRC_3V3.2(VIN) PWRC_5V.2(VIN) R1.1 R11.1 U19.250 U19.251 U19.252 U19.253 U19.254 U19.255 U19.256 U19.257 U19.258 U19.259 U19.260
+5V: C3.1 C4.1 C13.1 C14.1 C15.1 C24.1 C25.1 C26.1 C73.1 C74.1 C111.2 C114.2 CN3.1 CN4.2 R3.1 SATA1.14(P7) SATA1.15(P8) SATA1.16(P9) SATA2.14(P7) SATA2.15(P8) SATA2.16(P9) U2.2 U18.10(VCC5V) USB2_PROT_1.2(IN) USB2_PROT_2.2(IN)
GND: B1.2 BARREL_JACK.2 BARREL_JACK.3 BARREL_JACK.5 C1.2 C3.2 C4.2 C5.2 C6.2 C8.2 C9.2 C10.2 C11.2 C12.2 C13.2 C14.2 C15.2 C24.2 C25.2 C26.2 C27.1 C28.1 C29.2 C30.1 C31.2 C32.1 C35.1 C36.1 C37.1 C38.2 C39.2 C40.2 C41.2 C42.2 C43.2 C52.1 C53.2 C54.1 C55.1 C58.2 C59.1 C60.1 C61.1 C62.1 C63.1 C64.2 C65.2 C66.2 C67.2 C68.2 C69.2 C70.2 C71.2 C72.1 C73.2 C74.2 C75.1 C76.1 C77.2 C78.1 C79.1 C80.1 C81.1 C82.1 C111.1 C112.2 C113.1 C114.1 C115.2 C124.1 C125.1 C126.2 C127.2 C128.1 C129.1 CN3.3 CN3.4 CN4.1 CN4.5 CN4.6 D1.2 D3.2 D4.2 D5.2 D9.2 ETH_CRY.2(GND) ETH_CTRL.40(GND) ETH_CTRL.48(CLKREQB) ETH_CTRL.49(GND) ETH_JACK.1(GND) ETH_JACK.2(GND) L5.2 M.1 M.7 M.33 M.39 M.45 M.51 M.57 M.63 M.69 M.75 M.76 M.77 M1.1 M1.3 M1.9 M1.15 M1.21 M1.27 M1.33 M1.39 M1.45 M1.51 M1.57 M1.71 M1.73 M1.75 M1.76 M1.77 P1.2 PWRC_0V9.2(GND) PWRC_3V3.7(GND) PWRC_3V3.9(EP) PWRC_5V.7(GND) PWRC_5V.9(EP) Q1.2(S) Q2.2(S) R4.1 R6.1 R7.1 R8.1 R23.1 R25.2 R51.2 SATA1.1(S1) SATA1.4(S4) SATA1.7(S7) SATA1.11(P4) SATA1.12(P5) SATA1.13(P6) SATA1.17(P10) SATA1.18(P11) SATA1.19(P12) SATA1.23(SHELL) SATA1.24(SHELL) SATA2.1(S1) SATA2.4(S4) SATA2.7(S7) SATA2.11(P4) SATA2.12(P5) SATA2.13(P6) SATA2.17(P10) SATA2.18(P11) SATA2.19(P12) SATA2.23(SHELL) SATA2.24(SHELL) SW1.4(D) SW2.4(D) U18.5(GND) U18.13(GND) U18.18(GND) U19.11 U19.14 U19.17 U19.20 U19.23 U19.26 U19.29 U19.32 U19.35 U19.38 U19.41 U19.44 U19.47 U19.50 U19.53 U19.56 U19.59 U19.62 U19.65 U19.68 U19.71 U19.74 U19.77 U19.80 U19.83 U19.86 U19.89 U19.92 U19.95 U19.98 U19.101 U19.107 U19.110 U19.113 U19.116 U19.135 U19.136 U19.151 U19.158 U19.167 U19.170 U19.181 U19.182 U19.188 U19.189 U19.194 U19.195 U19.200 U19.201 U19.206 U19.207 U19.212 U19.213 U19.218 U19.219 U19.224 U19.225 U19.230 U19.231 U19.236 U19.237 U19.242 U19.243 U19.248 U19.249 U19.261(EH) U19.262(EH) USB1.4(GND) USB1.8(GND) USB1.9(GND) USB1.10(GND) USB1.11(GND) USB1.12(GND) USB2.4(GND) USB2.8(GND) USB2.9(GND) USB2.10(GND) USB2.11(GND) USB2.12(GND) USB2_PROT_1.1(GND) USB2_PROT_2.1(GND) USB3.2(TMDS Data 2 Shield) USB3.5(TMDS Data 1 Shield) USB3.8(TMDS Data 0 Shield) USB3.11(TMDS Clock Shield) USB3.17(DDC/CEC Ground)
VBAT: B1.1 R17.1
VCC: C5.1 C6.1 C27.2 C28.2 C38.1 C39.1 C40.1 C41.1 C42.1 C112.1 L1.2 L2.2 M1.2 M1.4 M1.70 M1.72 M1.74 PWRC_0V9.3(VIN) R14.2 R16.2 R28.1 R29.1 R52.2 U3.2 U4.2 U18.23(VCCA) U20.1 U21.1
VCC_ETH: C52.2 C53.1 C54.2 C55.2 C60.2 C62.2 C65.1 C66.1 C68.1 C69.1 C70.1 ETH_CRY.1(ENABLE CONTROL) ETH_CRY.4(VDD) ETH_CTRL.15(AVDD33) ETH_CTRL.19(AVDD33) ETH_CTRL.29(DVDD33) ETH_CTRL.33(AVDD33) ETH_CTRL.34(AVDD33_XTAL) ETH_CTRL.43(EVDD33) ETH_CTRL.46(DVDD33) ETH_JACK.L2(LED_G+O-) ETH_JACK.L4(LED_Y+) ETH_JACK.R5(CT) ETH_JACK.R6(CT) L2.1 R18.2 R22.2
9ETH: C58.1 C59.2 C61.2 C63.2 C64.1 C67.1 C71.1 C72.2 ETH_CTRL.8(DVDD09) ETH_CTRL.11(AVDD09) ETH_CTRL.16(AVDD09) ETH_CTRL.22(AVDD09) ETH_CTRL.28(DVDD09) ETH_CTRL.37(EVDD09) ETH_CTRL.47(DVDD09) L3.2 R24.2
BL_USB_N: M.5 U19.67
BL_USB_P: M.3 U19.69
CLOCK_ETH: ETH_CRY.3(OUTPUT) ETH_CTRL.10(CKXTAL1)
ETH_CLK_N: ETH_CTRL.45(REFCLK_N) U19.87
ETH_CLK_P: ETH_CTRL.44(REFCLK_P) U19.85
ETH_MDI0_N: ETH_CTRL.14(MDIN0) ETH_JACK.R2(TD1-)
ETH_MDI0_P: ETH_CTRL.13(MDIP0) ETH_JACK.R1(TD1+)
ETH_MDI1_N: ETH_CTRL.18(MDIN1) ETH_JACK.R4(TD2-)
ETH_MDI1_P: ETH_CTRL.17(MDIP1) ETH_JACK.R3(TD2+)
ETH_MDI2_N: ETH_CTRL.21(MDIN2) ETH_JACK.R8(TD3-)
ETH_MDI2_P: ETH_CTRL.20(MDIP2) ETH_JACK.R7(TD3+)
ETH_MDI3_N: ETH_CTRL.24(MDIN3) ETH_JACK.R9(TD4+)
ETH_MDI3_P: ETH_CTRL.23(MDIP3) ETH_JACK.R10(TD4-)
ETH_RST_N: C35.2 C43.1 ETH_CTRL.36(PERSTB) M.52 M1.50 R9.1 R14.1 U19.105
ETH_RX_N: C56.2 U19.42
ETH_RX_P: C57.2 U19.40
ETH_TX_N: ETH_CTRL.42(HSIN) U19.39
ETH_TX_P: ETH_CTRL.41(HSIP) U19.37
ETH_WAKE_N: ETH_CTRL.2(LANWAKEB) M.55 M1.54 R13.2 R16.1 U19.103
FAN2_CTL: CN4.4 Q2.1(G) U19.2
FAN2_TAC: CN4.3 R52.1 U19.4
FAN_CTRL: CN3.2 Q2.3(D)
HDMI_5V_OUT: C113.2 U18.12(5V_OUT) USB3.18(+5V Power)
HDMI_CEC_B: U18.6(CEC_B) USB3.13(CEC)
HDMI_CLK_N: C123.1 U19.197 USB3.12(TMDS Clock-)
HDMI_CLK_P: C122.1 U19.199 USB3.10(TMDS Clock+)
HDMI_D0_N: C121.1 U19.203 USB3.9(TMDS Data 0-)
HDMI_D0_P: C120.1 U19.205 USB3.7(TMDS Data 0+)
HDMI_D1_N: C119.1 U19.209 USB3.6(TMDS Data 1-)
HDMI_D1_P: C118.1 U19.211 USB3.4(TMDS Data 1+)
HDMI_D2_N: C117.1 U19.215 USB3.3(TMDS Data 2-)
HDMI_D2_P: C116.1 U19.217 USB3.1(TMDS Data 2+)
HDMI_HPD_B: U18.9(HPD_B) USB3.19(Hot Plug Detect)
HDMI_S0: Q1.3(D) R43.1 R44.1 R45.1 R46.1 R47.1 R48.1 R49.1 R50.1
HDMI_SCL_B: U18.7(SCL_B) USB3.15(SCL)
HDMI_SDA_B: U18.8(SDA_B) USB3.16(SDA)
LED0: ETH_CTRL.30(LED0/EEDI/SPISI/SDA) R21.2
LED2: ETH_CTRL.25(LED2/EEDO/SPIS0) R20.1
LP_CEC_A: U18.24(CEC_A) U19.119
LP_HPD_A: U18.3(HPD_A) U19.183
LP_SCL_A: U18.1(SCL_A) U19.171 U21.2
LP_SDA_A: U18.2(SDA_A) U19.169 U20.2
NVME_CLK_N: M1.53 U19.90
NVME_CLK_P: M1.55 U19.88
NVME_CLKREQ_N: M1.52 U19.100
NVME_RX0_N: M1.47 U19.18
NVME_RX0_P: M1.49 U19.16
NVME_RX1_N: M1.35 U19.24
NVME_RX1_P: M1.37 U19.22
NVME_RX2_N: M1.23 U19.30
NVME_RX2_P: M1.25 U19.28
NVME_RX3_N: M1.11 U19.36
NVME_RX3_P: M1.13 U19.34
NVME_TX0_N: C50.1 U19.15
NVME_TX0_P: C51.1 U19.13
NVME_TX1_N: C48.1 U19.21
NVME_TX1_P: C49.1 U19.19
NVME_TX2_N: C46.1 U19.27
NVME_TX2_P: C47.1 U19.25
NVME_TX3_N: C44.1 U19.33
NVME_TX3_P: C45.1 U19.31
POWEXT: ETH_CTRL.6(POW_EXT_SWR) PWRC_0V9.5(EN)
PWR_SW: C128.2 P1.1 SW1.1(A) U19.1
RST_SW: C129.2 SW2.1(A) U19.3
S0_STATE_EN: Q1.1(G) R51.1 U18.4(LS_OE) U19.7
SATA0_RX_N: C17.2 U19.54
SATA0_RX_P: C16.2 U19.52
SATA0_TX_N: C18.2 U19.51
SATA0_TX_P: C19.2 U19.49
SATA1_RX_N: C21.2 U19.60
SATA1_RX_P: C20.2 U19.58
SATA1_TX_N: C22.2 U19.57
SATA1_TX_P: C23.2 U19.55
USB1N: D1.3 U19.73
USB1OC: U19.129 USB2_PROT_1.5(OC2#) USB2_PROT_1.8(OC1#) USB2_PROT_2.5(OC2#) USB2_PROT_2.8(OC1#)
USB1P: D1.1 U19.75
USB2N: D3.3 U19.79
USB2P: D3.1 U19.81
USB3N: D4.3 U19.109
USB3P: D4.1 U19.111
USB4N: D5.3 U19.72
USB4P: D5.1 U19.70
USB_VBUS_P1: C75.2 C79.2 D1.5 USB1.1(VBUS) USB2_PROT_1.7(OUT1)
USB_VBUS_P2: C76.2 C80.2 D3.5 USB1.5(VBUS) USB2_PROT_1.6(OUT2)
USB_VBUS_P3: C77.1 C81.2 D4.5 USB2.1(VBUS) USB2_PROT_2.7(OUT1)
USB_VBUS_P4: C78.2 C82.2 D5.5 USB2.5(VBUS) USB2_PROT_2.6(OUT2)
WIFI_CLK_N: M.49 U19.96
WIFI_CLK_P: M.47 U19.94
WIFI_CLKREQ_N: M.53 U19.102
WIFI_RX_N: M.37 U19.66
WIFI_RX_P: M.35 U19.64
WIFI_SUSCLK: M.50 U19.131
WIFI_TX_N: C34.2 U19.63
WIFI_TX_P: C33.2 U19.61
$1N466: PWRC_5V.3(EN) R1.2
$1N467: C2.1 PWRC_5V.1(BST)
$1N468: C2.2 PWRC_5V.8(SW) U2.1
$1N471: PWRC_5V.5(FB) R3.2 R4.2
$1N472: PWRC_5V.4(RT/CLK) R6.2
$1N481: PWRC_3V3.4(RT/CLK) R7.2
$1N482: PWRC_3V3.5(FB) R8.2 U3.1
$1N487: C7.2 PWRC_3V3.8(SW) U4.1
$1N488: C7.1 PWRC_3V3.1(BST)
$1N489: PWRC_3V3.3(EN) R11.2
$1N496: PWRC_5V.6(COMP) R2.1
$1N497: C1.1 R2.2
$1N498: C8.1 R5.2
$1N499: PWRC_3V3.6(COMP) R5.1
$2N302: C16.1 SATA1.6(S6)
$2N303: C17.1 SATA1.5(S5)
$2N304: C18.1 SATA1.3(S3)
$2N305: C19.1 SATA1.2(S2)
$2N322: C23.1 SATA2.2(S2)
$2N323: C22.1 SATA2.3(S3)
$2N324: C21.1 SATA2.5(S5)
$2N325: C20.1 SATA2.6(S6)
$3N321: C33.1 M.41
$3N324: C34.1 M.43
$4N424: C44.2 M1.5
$4N427: C46.2 M1.17
$4N430: C48.2 M1.29
$4N433: C50.2 M1.41
$4N440: C45.2 M1.7
$4N441: C47.2 M1.19
$4N442: C49.2 M1.31
$4N443: C51.2 M1.43
$5N686: C57.1 ETH_CTRL.38(HSOP)
$5N707: ETH_JACK.L1(LED_G-O+) R20.2
$5N708: ETH_JACK.L3(LED_Y-) R21.1
$5N753: ETH_CTRL.12(RSET) R23.2
$5N756: ETH_CTRL.27(LED1/EESK/SPISC) R22.1
$5N761: PWRC_0V9.1(FB) R24.1 R25.1
$5N768: ETH_CTRL.1(ISOLATEB) R18.1
$5N769: C56.1 ETH_CTRL.39(HSON)
$5N780: L3.1 PWRC_0V9.4(SW)
$6N412: R28.2 USB2_PROT_1.3(EN1#†) USB2_PROT_1.4(EN2#†)
$6N413: R29.2 USB2_PROT_2.3(EN1#†) USB2_PROT_2.4(EN2#†)
$6N432: D1.4 USB1.2(D-)
$6N433: D4.4 USB2.2(D-)
$6N434: D5.4 USB2.6(D-)
$6N435: D3.4 USB1.6(D-)
$6N436: D1.6 USB1.3(D+)
$6N437: D3.6 USB1.7(D+)
$6N438: D4.6 USB2.3(D+)
$6N439: D5.6 USB2.7(D+)
$7N562: L5.1 USB3.20(GND) USB3.21(GND) USB3.22(GND) USB3.23(GND)
$7N573: C117.2 R44.2 U18.21(D2-)
$7N574: C118.2 R45.2 U18.20(D1+)
$7N575: C119.2 R46.2 U18.19(D1-)
$7N576: C121.2 R48.2 U18.16(D0-)
$7N577: C122.2 R49.2 U18.15(CLK+)
$7N578: C123.2 R50.2 U18.14(CLK-)
$7N589: C116.2 R43.2 U18.22(D2+)
$7N590: C120.2 R47.2 U18.17(D0+)
$7N615: C115.1 U18.11(CT_HPD)
$8N796: D9.3 U19.115
$8N974: D9.1 R17.2

Not connected (* = marked no-connect by the designer): ETH_CTRL 3(GPI)* 4(NC)* 5(NC)* 7(NC)* 9(CKXTAL2)* 26(SPICSB)* 31(EECS/SCL)* 32(EEPROM_SEL/PPS_PIN)* 35(LED3)*; M 6* 8* 9* 10* 11* 12* 13* 14* 15* 16* 17* 18* 19* 20* 21* 22* 23* 32* 34* 36* 38* 40* 42* 44* 46* 48* 54* 56* 58* 59* 60* 61* 62* 64* 65* 66* 67* 68* 70* 71* 73*; M1 6* 8* 10* 12* 14* 16* 18* 20* 22* 24* 26* 28* 30* 32* 34* 36* 38* 40* 42* 44* 46* 48* 56* 58* 67* 68* 69*; P2 1 2 3 4; P3 1 2 3 4; PWRC_0V9 6(NC/PG)*; SATA1 8(P1)* 9(P2)* 10(P3)* 20(P13)* 21(P14)* 22(P5)*; SATA2 8(P1)* 9(P2)* 10(P3)* 20(P13)* 21(P14)* 22(P5)*; SW1 2(B)* 3(C)*; SW2 2(B)* 3(C)*; U19 5* 6* 8* 9* 10* 12* 43* 45* 46* 48* 76* 78* 82* 84* 91* 93* 97* 99* 104* 106* 108* 112* 114* 117* 118* 120* 121* 122* 123* 124* 125* 126* 127* 128* 130* 132* 133* 134* 137* 138* 139* 140* 141* 142* 143* 144* 145* 146* 147* 148* 149* 150* 152* 153* 154* 155* 156* 157* 159* 160* 161* 162* 163* 164* 165* 166* 168* 172* 173* 174* 175* 176* 177* 178* 179* 180* 184* 185* 186* 187* 190* 191* 192* 193* 196* 198* 202* 204* 208* 210* 214* 216* 220* 221* 222* 223* 226* 227* 228* 229* 232* 233* 234* 235* 238* 239* 240* 241* 244* 245* 246* 247*; USB3 14(Reserved (N.C.))*

## Notes on the sheets
sheet 1
- PWR Source
- PWR Delivery - 5V
- PWR Delivery - 3.3V
- Decoupling Caps
sheet 3
- M.2 NVMe E-Key Slot
- PWR Stabilizer for Slot
sheet 4
- PWR M.2 M-Key
- M.2 NVMe M-Key Port
sheet 5
- PWR Delivery - 0.9V
- PWR Stabilizer
- Ethernet Controller
- Controller Clock
- Ethernet Port
sheet 6
- Short Prevention Chips (USB 2.0)
- USB 2.0 Ports & TVS Protection
sheet 7
- HDMI Controller Chip
- HDMI Port
- Sleep Control
sheet 8
- PCIe RST Unified
- PCIe WAKE Unified
- CMOS Battery
- Fault Connections Unified
- PCB LAYOUT: Place these capacitors
- as close as physically possible to the
- SO-DIMM VIN pins (250-260)
- 260-Pin SODIMM Connector
- Fan Headers
- μAtlas
- PWR Control Switches
- PWM to Analog for other Fans
- Standoffs
